# EasyEDA Pro project TEMP_PRO.epro, schematic Schematic_5, sheet 3 of 3

## Sheets
3 P3: Create Date: 2025-04-02; Page Name: P3; Update Date: 2025-04-01
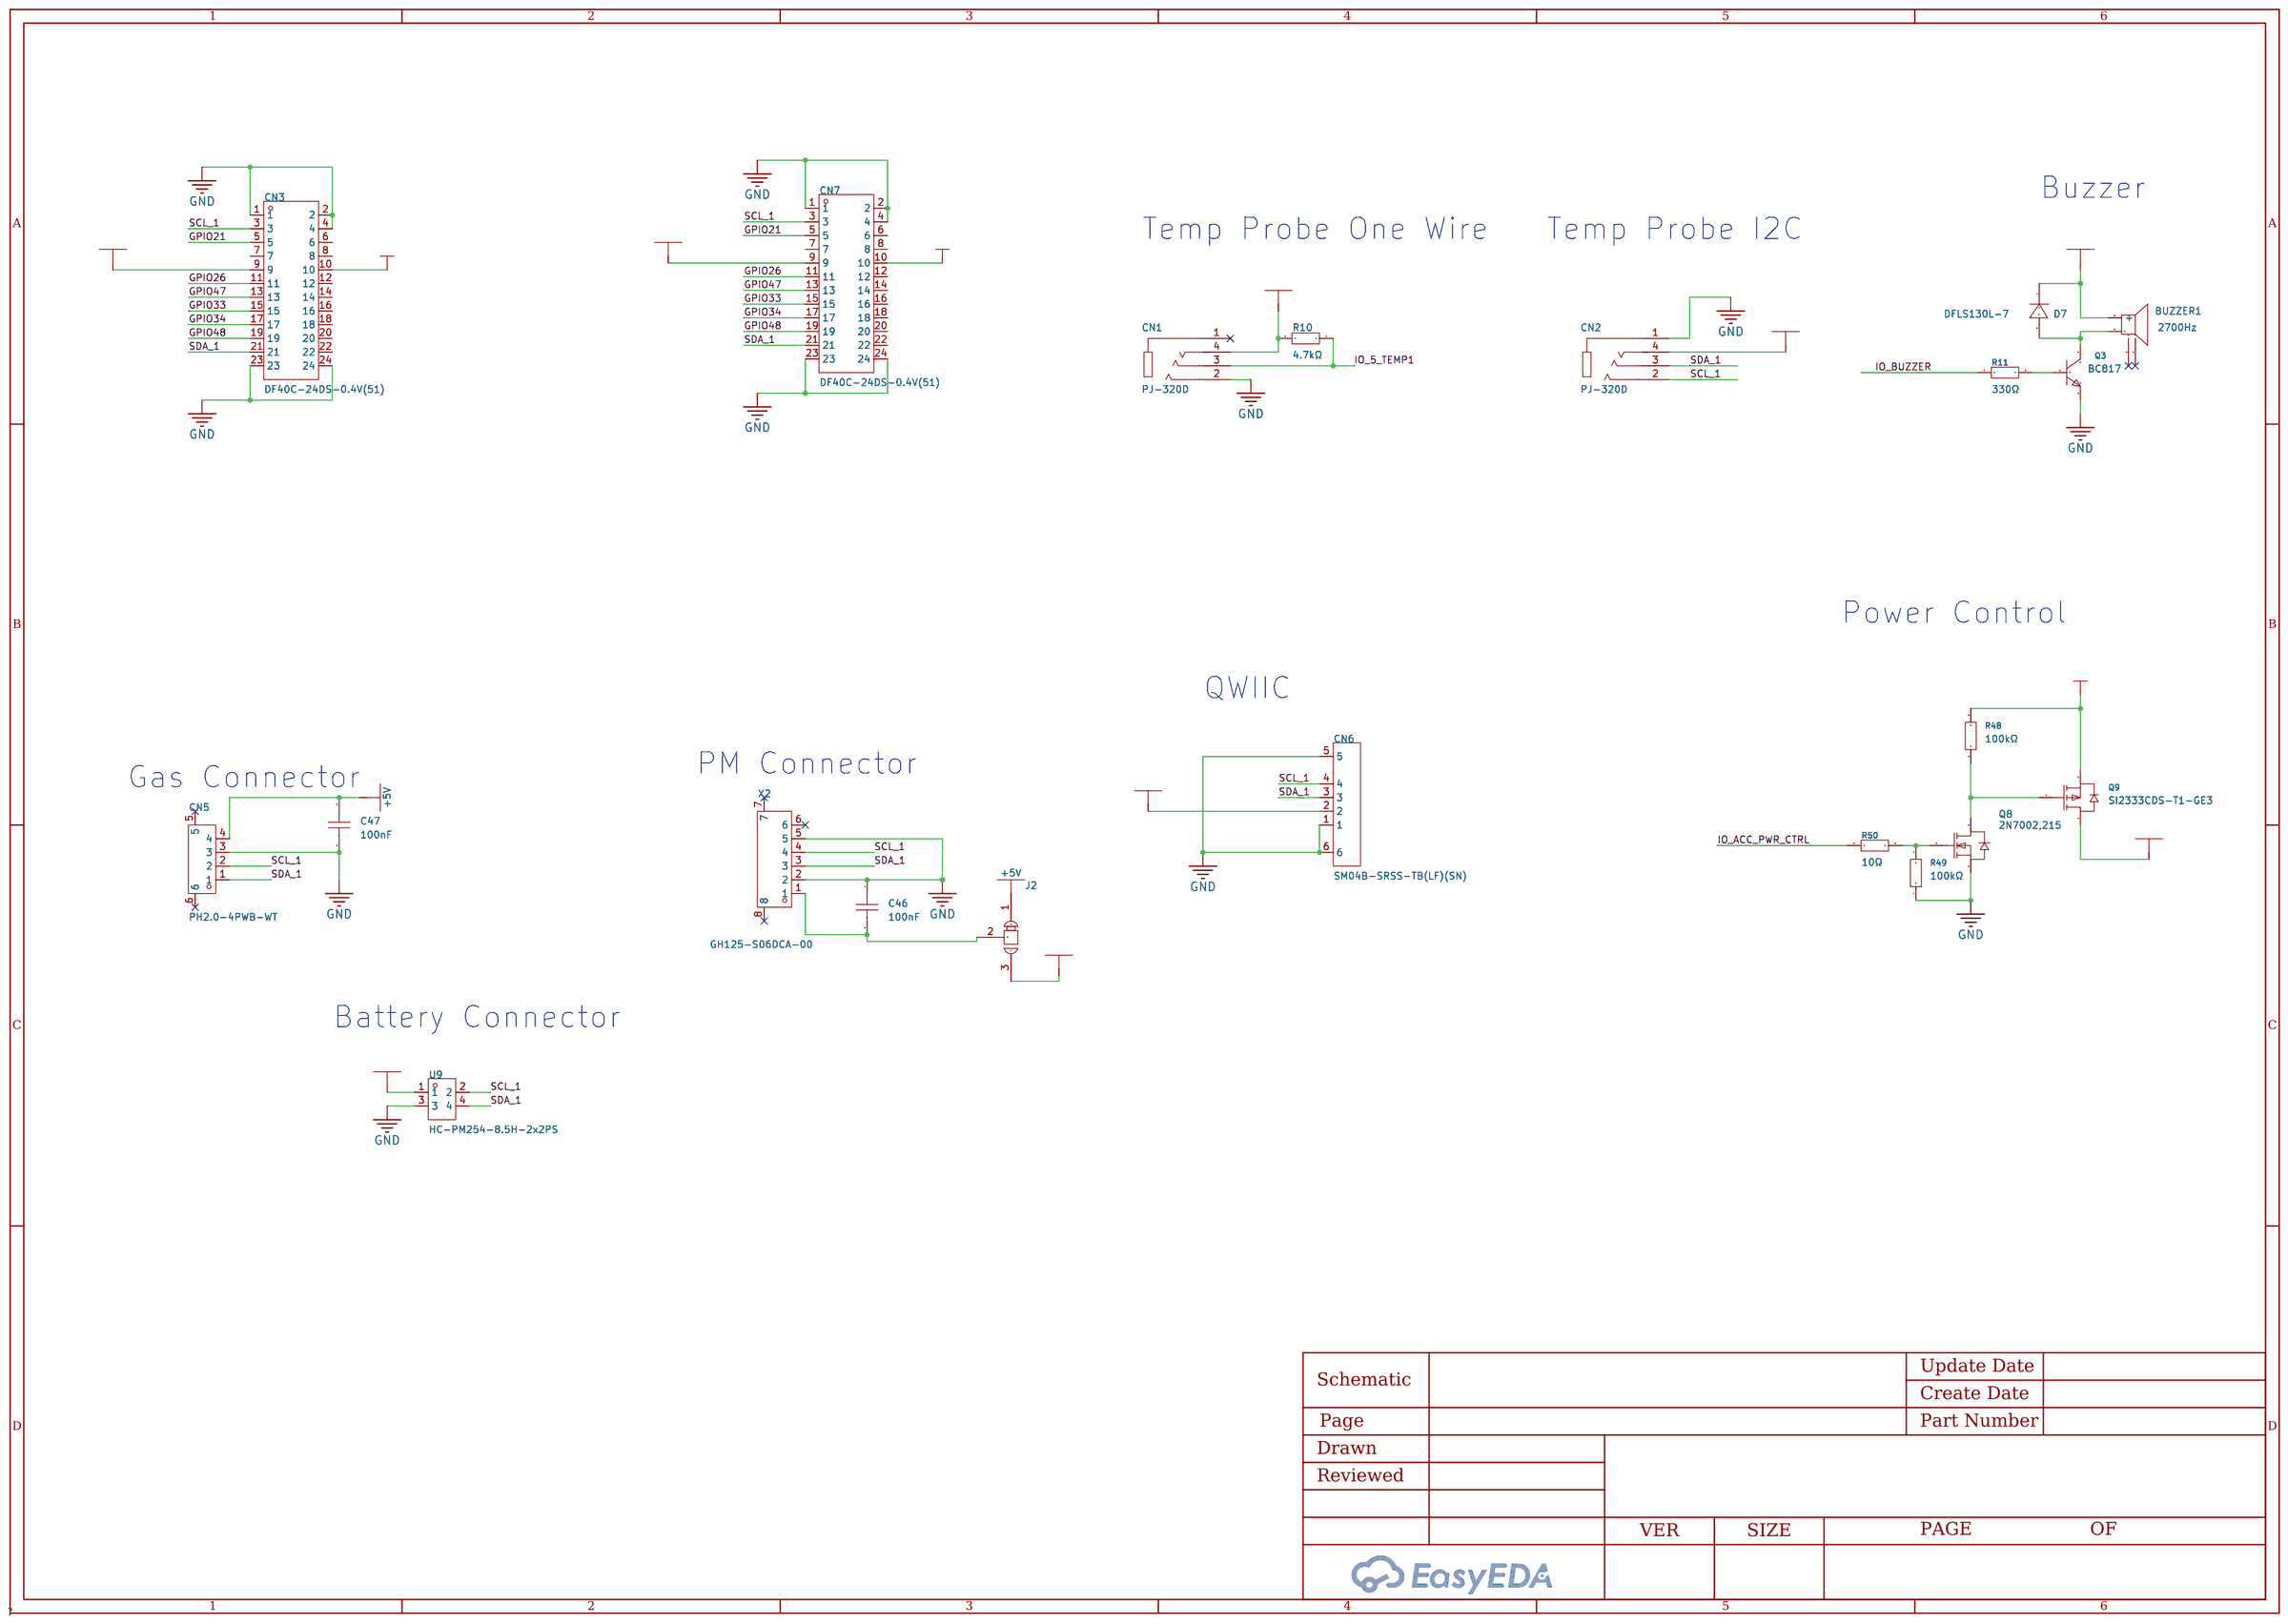
[diagram p2: P3]

## Parts
BUZZER1  2700Hz  [BUZ-SMD_4P-L8.5-W8.5-P8.50-BR]
C46  100nF  [C0603]
C47  100nF  [C0603]
CN1  PJ-320D  [AUDIO-SMD_PJ-320D]
CN2  PJ-320D  [AUDIO-SMD_PJ-320D]
CN3  DF40C-24DS-0.4V(51)  [CONN-SMD_DF40C-24DS-0.4V51]
CN5  PH2.0-4PWB-WT  [CONN-SMD_2.0-4PWB-WT]
CN6  SM04B-SRSS-TB(LF)(SN)  [CONN-SMD_4P-P1.00_SM04B-SRSS-TB-LF-SN]
CN7  DF40C-24DS-0.4V(51)  [CONN-SMD_DF40C-24DS-0.4V51]
D7  DFLS130L-7  [POWERDI-123_L2.8-W1.8-LS3.7-RD]
J2  -  [Jumper:SolderJumper-3_P1.3mm_Bridged12_Pad1.0x1.5mm]  (no BOM)
Q3  BC817  [SOT-23-3_L2.9-W1.4-P1.91-LS2.6-BR]
Q8  2N7002,215  [SOT-23_L2.9-W1.3-P1.90-LS2.4-BR]
Q9  SI2333CDS-T1-GE3  [SOT-23_L2.9-W1.3-P1.90-LS2.4-BR]
R10  4.7kΩ  [R0402]
R11  330Ω  [R0402]
R48  100kΩ  [R0402]
R49  100kΩ  [R0402]
R50  10Ω  [R0402]
U9  HC-PM254-8.5H-2x2PS  [HDR-SMD_4P-P2.54-V-F-R2-C2-LS6.8]
X2  GH125-S06DCA-00  [CONN-SMD_6P-P1.25_JUSHUO_GH125-S06DCA-00]

## Library data of the parts
BUZZER1 = MLT-8530: Oscillator Circuit:无源(外部驱动) Technology Type:电磁式 Rated Voltage:3.6V Operating Voltage:2.5V~4.5V Operating Voltage:2.5V~4.5V Frequency:2700Hz Sound Pressure Level (SPL):80dB@5V,10cm Length:8.5mm Width:8.5mm Height:3.3mm; Supplier Part: C94599; Manufacturer: 华能; Supplier Footprint: SMD; JLCPCB Part Class: ExtendedPart; Datasheet: https://atta.szlcsc.com/upload/public/pdf/source/20170522/1495448322339.pdf; Supplier: LCSC; Oscillator Circuit: 无源(外部驱动); Technology Type: 电磁式; Rated Voltage: 3.6V; Operating Voltage: 2.5V~4.5V; Sound Pressure Level (SPL): 80dB@5V,10cm; Length: 8.5mm; Width: 8.5mm; Height: 3.3mm
C46 C47 = 0603B104K500NT_C30926: Capacitance: Tolerance:±10% Tolerance:±10% Voltage Rated: Temperature Coefficient:; LCSC Part Name: 100nF ±10% 50V; Supplier Part: C30926; Manufacturer: FH(风华); Manufacturer Part: 0603B104K500NT; Supplier Footprint: 0603; JLCPCB Part Class: Extended Part; Datasheet: https://atta.szlcsc.com/upload/public/pdf/source/20170923/C30926_1506149436298988724.pdf; Supplier: LCSC; Tolerance: ±10%
CN1 CN2 = PJ-320D_C431535: Connector Type:3.5mm耳机座 Current Rating (Max):300mA Voltage Rating (Max):50V Operating Temperature Range:-16℃~+65℃ Operating Temperature Range:-16℃~+65℃; LCSC Part Name: 3.5mm耳机座; Supplier Part: C431535; Manufacturer: SHOU HAN(首韩); Supplier Footprint: SMD; JLCPCB Part Class: Extended Part; Datasheet: https://atta.szlcsc.com/upload/public/pdf/source/20190925/C431535_8B274506621F6117FB020BF07A197848.pdf; Supplier: LCSC; Connector Type: 3.5mm耳机座; Current Rating (Max): 300mA; Voltage Rating (Max): 50V; Operating Temperature Range: -16℃~+65℃
CN3 CN7 = DF40C-24DS-0.4V(51): Number of Pins:24P Pitch:0.4mm Number of Rows:2 Gender:Female Mounting Style:Brick nogging Current Rating (Max):300mA Contact Plating:Gold Operating Temperature Range:-35℃~+85℃ Operating Temperature Range:-35℃~+85℃; LCSC Part Name: PIN：24P 间距0.4mm 母 立贴; Supplier Part: C424640; Manufacturer: HRS(广濑); Supplier Footprint: SMD,P=0.4mm; JLCPCB Part Class: Extended Part; Datasheet: https://atta.szlcsc.com/upload/public/pdf/source/20190903/C424648_4BEB475664B3701E3114D0DD20EED667.pdf; Supplier: LCSC; Number of Pins: 24P; Pitch: 0.4mm; Number of Rows: 2; Gender: Female; Mounting Style: Brick nogging; Current Rating (Max): 300mA; Contact Plating: Gold; Operating Temperature Range: -35℃~+85℃
CN5 = PH2.0-4PWB-WT: Reference Series:- Pitch:2mm Pins Structure:1x4P Number of Rows:1 Number of PINs Per Row:4 Row Spacing:- Gender:公型插针 Mounting Style:Surface Mount Current Rating (Max):- Operating Temperature Range:- Operating Temperature Range:-; LCSC Part Name: 4P 2.0mm 卧贴; Supplier Part: C722764; Manufacturer: CAX(创都); Supplier Footprint: SMD,P=2mm; JLCPCB Part Class: Extended Part; Datasheet: https://atta.szlcsc.com/upload/public/pdf/source/20200902/C722762_5E03984919915C34BED044C44858EC0E.pdf; Supplier: LCSC; Pitch: 2mm; Pins Structure: 1x4P; Number of Rows: 1; Number of PINs Per Row: 4; Gender: 公型插针; Mounting Style: Surface Mount
CN6 = SM04B-SRSS-TB(LF)(SN): Pins Structure:1x4P Pitch:1mm Mounting Style:Horizontal attachment Reference Series:SH Number of Pins:4P Number of Rows:1 Number of PINs Per Row:4 Row Spacing:- Current Rating (Max):1A Contact Material:Copper alloy Contact Plating:Tin Operating Temperatur; LCSC Part Name: 1x4P 间距:1mm 卧贴 系列:SH; Supplier Part: C160404; Manufacturer: JST; Supplier Footprint: SMD,P=1mm,卧贴; Datasheet: https://atta.szlcsc.com/upload/public/pdf/source/20181010/C265335_7D2AD766CA0E20E745663C87507A223E.pdf; Supplier: LCSC; Pins Structure: 1x4P; Pitch: 1mm; Mounting Style: Horizontal attachment; Reference Series: SH; Number of Pins: 4P; Number of Rows: 1; Number of PINs Per Row: 4; Current Rating (Max): 1A; Contact Material: Copper alloy; Contact Plating: Tin; Operating Temperature Range: -25℃~+85℃; Rated Voltage (Max): 50V; Plastic Material: PA; Flame Retardant Rating: UL94V-0; Supplementary Features: Auxiliary soldering legs; Colour: White; Z-Height of the Board: 2.9mm; X-Length of Bottom Edge on Board (Spacing Line): 6mm; Y-Width of Bottom Edge on Board: 4.32mm
D7 = DFLS130L-7: Forward Voltage (Vf@If):310mV@1A Reverse Voltage (Vr):30V Average Rectified Current (Io):1A; LCSC Part Name: 电压:30V 电流:1A; Supplier Part: C110493; Manufacturer: DIODES(美台); Supplier Footprint: Power-DI-123; JLCPCB Part Class: Extended Part; Datasheet: https://atta.szlcsc.com/upload/public/pdf/source/20170427/1493286393645.pdf; Supplier: LCSC; Forward Voltage (Vf@If): 310mV@1A; Reverse Voltage (Vr): 30V; Average Rectified Current (Io): 1A
J2 = Jumper:SolderJumper-3_P1.3mm_Bridged12_Pad1.0x1.5mm
Q3 = BC817: Transistor Type: Collector Current (Ic): Collector-Emitter Breakdown Voltage (Vceo): Power Dissipation (Pd): Transition Frequency (fT):100MHz Collector Cut-Off Current (Icbo):100nA Collector-Emitter Saturation Voltage (VCE(sat)@Ic,Ib):700mV@500mA,50mA Ope; LCSC Part Name: NPN 电流:500mA 耐压:45V; Supplier Part: C466643; Manufacturer: High Diode(海德); Supplier Footprint: SOT-23; JLCPCB Part Class: 扩展库; Datasheet: https://atta.szlcsc.com/upload/public/pdf/source/20191203/C466643_48783E87EF98B3225D10B7DDEC5B406B.pdf; Supplier: LCSC; Transition Frequency (fT): 100MHz; Collector Cut-Off Current (Icbo): 100nA; Collector-Emitter Saturation Voltage (VCE(sat)@Ic,Ib): 700mV@500mA,50mA
Q8 = 2N7002,215: Type:1个NChannel Drain Source Voltage (Vdss): Continuous Drain Current (Id): Power Dissipation (Pd): Drain Source On Resistance (RDS(on)@Vgs,Id):5Ω@10V,500mA Gate Threshold Voltage (Vgs(th)@Id):2.5V@250uA Input Capacitance (Ciss@Vds):50pF@10V Operating Tem; LCSC Part Name: 1个N沟道 耐压:60V 电流:300mA; Supplier Part: C65189; Manufacturer: Nexperia(安世); Supplier Footprint: SOT-23; JLCPCB Part Class: Extended Part; Datasheet: https://atta.szlcsc.com/upload/public/pdf/source/20170103/1483439882638.pdf; Supplier: LCSC; Type: 1个NChannel; Drain Source On Resistance (RDS(on)@Vgs,Id): 5Ω@10V,500mA; Gate Threshold Voltage (Vgs(th)@Id): 2.5V@250uA; Input Capacitance (Ciss@Vds): 50pF@10V; Operating Temperature: -65℃~+150℃@(Tj)
Q9 = SI2333CDS-T1-GE3_C48179: Type: Drain Source Voltage (Vdss): Continuous Drain Current (Id): Power Dissipation (Pd):； Drain Source On Resistance (RDS(on)@Vgs,Id):35mΩ@4.5V,5.1A Gate Threshold Voltage (Vgs(th)@Id):1V@250uA Total Gate Charge (Qg@Vgs):25nC@4.5V Input Capacitance (Ciss; LCSC Part Name: P沟道 耐压:12V 电流:5.1A; Supplier Part: C48179; Manufacturer: VISHAY(威世); Supplier Footprint: SOT-23-3; JLCPCB Part Class: Extended Part; Datasheet: https://atta.szlcsc.com/upload/public/pdf/source/20150504/1457707283392.pdf; Supplier: LCSC; Power Dissipation (Pd): ；; Drain Source On Resistance (RDS(on)@Vgs,Id): 35mΩ@4.5V,5.1A; Gate Threshold Voltage (Vgs(th)@Id): 1V@250uA; Total Gate Charge (Qg@Vgs): 25nC@4.5V; Input Capacitance (Ciss@Vds): 1.225nF@6V; Operating Temperature: -55℃~+150℃@(Tj); Reverse Transfer Capacitance (Crss@Vds): 120pF
R10 = 0402WGF4701TCE: Resistance:4700Ω Tolerance:±1% Tolerance:±1% Power(Watts): Overload Voltage (Max): Temperature Coefficient:±100ppm/℃ Temperature Coefficient:±100ppm/℃ Type:Thick Film Resistors Operating Temperature Range:-55℃~+155℃ Operating Temperature Range:-55℃~+155℃; LCSC Part Name: 4.7kΩ ±1% 62.5mW 厚膜电阻; Supplier Part: C25900; Manufacturer: UNI-ROYAL(厚声); Supplier Footprint: 0402; JLCPCB Part Class: Basic Part; Datasheet: https://atta.szlcsc.com/upload/public/pdf/source/20200306/C422600_1E6D84923E4A46A82E41ADD87F860B5C.pdf; Supplier: LCSC; Tolerance: ±1%; Temperature Coefficient: ±100ppm/℃; Type: Thick Film Resistors; Operating Temperature Range: -55℃~+155℃
R11 = 0402WGF3300TCE: Type:Thick Film Resistors Resistance: Tolerance:±1% Tolerance:±1% Power(Watts): Overload Voltage (Max): Temperature Coefficient:±100ppm/℃ Temperature Coefficient:±100ppm/℃ Operating Temperature Range:-55℃~+155℃ Operating Temperature Range:-55℃~+155℃; LCSC Part Name: 330Ω ±1% 62.5mW 厚膜电阻; Supplier Part: C25104; Manufacturer: UNI-ROYAL(厚声); Supplier Footprint: 0402; JLCPCB Part Class: Basic Part; Datasheet: https://atta.szlcsc.com/upload/public/pdf/source/20200306/C422600_1E6D84923E4A46A82E41ADD87F860B5C.pdf; Supplier: LCSC; Type: Thick Film Resistors; Tolerance: ±1%; Temperature Coefficient: ±100ppm/℃; Operating Temperature Range: -55℃~+155℃
R48 R49 = 0402WGF1003TCE: Type:Thick Film Resistors Resistance:100kΩ Tolerance:±1% Tolerance:±1% Power(Watts): Overload Voltage (Max): Temperature Coefficient:±100ppm/℃ Temperature Coefficient:±100ppm/℃ Operating Temperature Range:-55℃~+155℃ Operating Temperature Range:-55℃~+155℃; LCSC Part Name: 100kΩ ±1% 62.5mW 厚膜电阻; Supplier Part: C25741; Manufacturer: UNI-ROYAL(厚声); Supplier Footprint: 0402; JLCPCB Part Class: Basic Part; Datasheet: https://atta.szlcsc.com/upload/public/pdf/source/20200306/C422600_1E6D84923E4A46A82E41ADD87F860B5C.pdf; Supplier: LCSC; Type: Thick Film Resistors; Tolerance: ±1%; Temperature Coefficient: ±100ppm/℃; Operating Temperature Range: -55℃~+155℃
R50 = 0402WGF100JTCE: Type:Thick Film Resistors Resistance:10Ω Tolerance:±1% Tolerance:±1% Power(Watts): Overload Voltage (Max): Temperature Coefficient:±200ppm/℃ Temperature Coefficient:±200ppm/℃ Operating Temperature Range:-55℃~+155℃ Operating Temperature Range:-55℃~+155℃; LCSC Part Name: 10Ω ±1% 62.5mW 厚膜电阻; Supplier Part: C25077; Manufacturer: UNI-ROYAL(厚声); Supplier Footprint: 0402; Datasheet: https://atta.szlcsc.com/upload/public/pdf/source/20200306/C422600_1E6D84923E4A46A82E41ADD87F860B5C.pdf; Supplier: LCSC; Type: Thick Film Resistors; Tolerance: ±1%; Temperature Coefficient: ±200ppm/℃; Operating Temperature Range: -55℃~+155℃
U9 = HC-PM254-8.5H-2x2PS: Holes Structure:2x2P Pitch:2.54mm Row Spacing:2.54mm Circular Hole / Square Hole:Square Hole Mounting Type:Standing paste Number of Rows:Double Row Number of Positions:4P Current Rating:3A Voltage Rating (Max):- Holes Direction:Top Insulation Height:8.5mm; LCSC Part Name: 间距2.54mm 2x2Pin 立贴 PW7.1 H8.5; Supplier Part: C27983455; Manufacturer: HC(虹成电子); Supplier Footprint: SMD,P=2.54mm; Datasheet: https://atta.szlcsc.com/upload/public/pdf/source/20250106/863006785F941A703577780CDA6C68F7.pdf; Supplier: LCSC; Holes Structure: 2x2P; Pitch: 2.54mm; Row Spacing: 2.54mm; Circular Hole / Square Hole: Square Hole; Mounting Type: Standing paste; Number of Rows: Double Row; Number of Positions: 4P; Current Rating: 3A; Holes Direction: Top; Insulation Height: 8.5mm; Contact Material: Brass; Contact Plating: Gold; Operating Temperature: -40℃~+105℃
X2 = GH125-S06DCA-00: Reference Series:GH Pitch:1.25mm Pins Structure:1x6P Number of Rows:1 Number of PINs Per Row:6 Row Spacing:- Gender:公型插针 Mounting Style:Surface Mount Current Rating (Max):1A Operating Temperature Range:-25℃~+85℃ Operating Temperature Range:-25℃~+85℃; LCSC Part Name: GH1.25卧式贴片 带扣; Supplier Part: C2886769; Manufacturer: JS(钜硕电子); Supplier Footprint: SMD,P=1.25mm; JLCPCB Part Class: Extended Part; Datasheet: https://atta.szlcsc.com/upload/public/pdf/source/20210818/CD11791E5ED3EDF45A7009E9C8A2BD4C.pdf; Supplier: LCSC; Reference Series: GH; Pitch: 1.25mm; Pins Structure: 1x6P; Number of Rows: 1; Number of PINs Per Row: 6; Gender: 公型插针; Mounting Style: Surface Mount; Current Rating (Max): 1A; Operating Temperature Range: -25℃~+85℃

## Nets
+3V3_CTRL: BUZZER1.1(+) CN1.4 CN2.4 CN3.9 CN6.2 CN7.9 D7.1 J2.3 Q9.3(D) R10.2 ; also on sheet 1
+5V: C47.1 CN5.4 J2.1
+VBAT: U9.1 ; also on sheet 1
GND: C46.1 C47.2 CN1.2 CN2.1 CN3.1 CN3.2 CN3.4 CN3.23 CN3.24 CN5.3 CN6.1 CN6.5 CN6.6 CN7.1 CN7.2 CN7.4 CN7.23 CN7.24 Q3.2(E) Q8.2(S) R49.1 U9.3 X2.2 X2.5 ; also on sheet 1 2
VCC_3V3: Q9.2(S) R48.2 ; also on sheet 1 2
VCC_5V: CN3.10 CN7.10 ; also on sheet 1
GPIO21: CN3.5 CN7.5 ; also on sheet 1
GPIO26: CN3.11 CN7.11 ; also on sheet 1
GPIO33: CN3.15 CN7.15 ; also on sheet 1
GPIO34: CN3.17 CN7.17 ; also on sheet 1
GPIO47: CN3.13 CN7.13 ; also on sheet 1
GPIO48: CN3.19 CN7.19 ; also on sheet 1
IO_5_TEMP1: CN1.3 R10.1 ; also on sheet 1
IO_ACC_PWR_CTRL: R50.1 ; also on sheet 1
IO_BUZZER: R11.2 ; also on sheet 1
SCL_1: CN2.2 CN3.3 CN5.2 CN6.4 CN7.3 U9.2 X2.4 ; also on sheet 1
SDA_1: CN2.3 CN3.21 CN5.1 CN6.3 CN7.21 U9.4 X2.3 ; also on sheet 1
$3N1448: C46.2 J2.2 X2.1
$3N1809: Q3.1(B) R11.1
$3N1812: BUZZER1.2 D7.2 Q3.3(C)
$3N2049: Q8.1(G) R49.2 R50.2
$3N2053: Q8.3(D) Q9.1(G) R48.1

Not connected (* = marked no-connect by the designer): BUZZER1 3* 4*; CN1 1*; CN3 6 7 8 12 14 16 18 20 22; CN5 5* 6*; CN7 6 7 8 12 14 16 18 20 22; X2 6* 7* 8*

## Notes on the sheets
sheet 3
- Buzzer
- Temp Probe One Wire
- Temp Probe I2C
- Power Control
- QWIIC
- PM Connector
- Gas Connector
- Battery Connector
